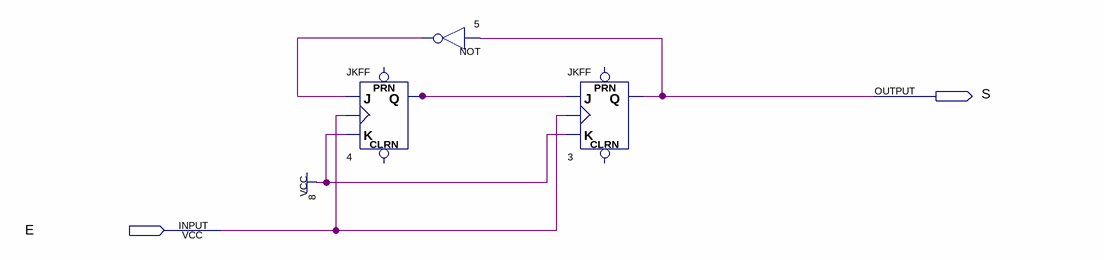
[diagram p0: schematic sheet]
// Quartus schematic div3.bdf as structural Verilog: 3 symbols, 2 pins
module div3 (
  input  E,
  output S
);

  wire n4_q, n5_out;

  JKFF u_4 (.K(1'b1), .J(n5_out), .CLK(E), .Q(n4_q));  // open: PRN, CLRN
  not u_5 (n5_out, S);
  JKFF u_3 (.K(1'b1), .J(n4_q), .CLK(E), .Q(S));  // open: PRN, CLRN
endmodule
